# Altium project DockConnector.PrjPcb
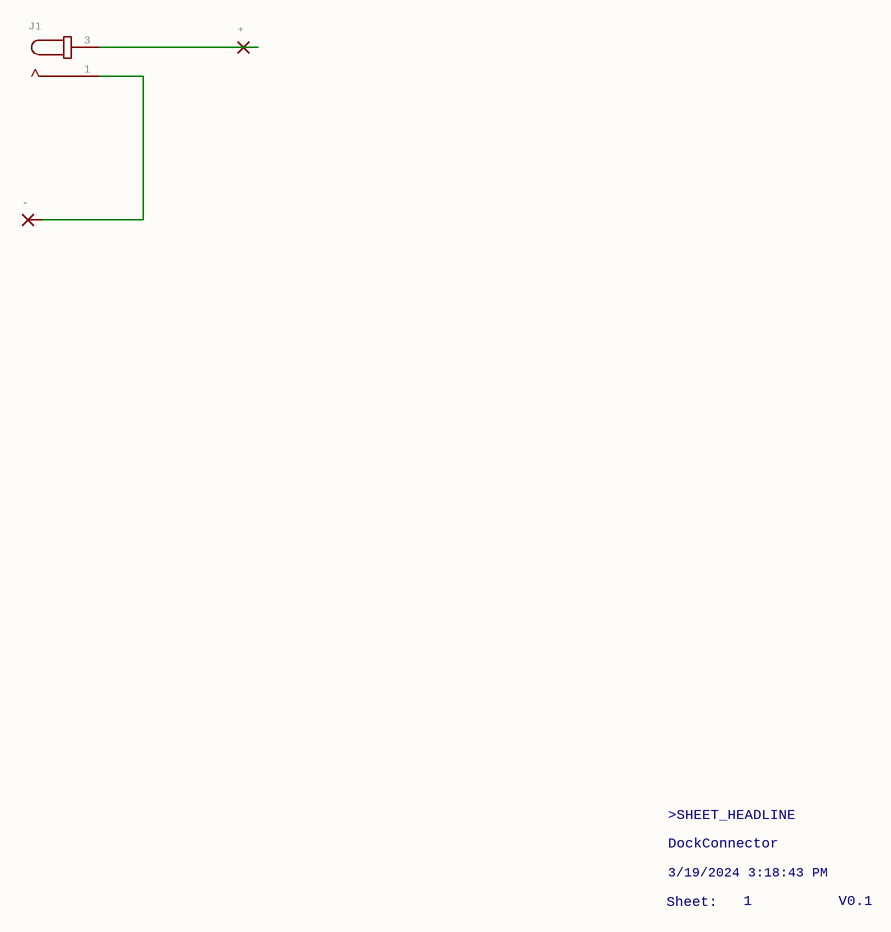
[diagram p0: DockConnector.SchDoc]
1 sheet, 3 parts. Net scope: global (net labels, ports and power ports of the same name join across sheets).
Board file: DockConnector.PcbDoc

## Sheet DockConnector.SchDoc: DockConnector
size 292 x 217 mm; Origin: Eagle; Date: 3/19/2024 3:18:43 PM; SheetNumber: 1; SCHEMATIC_VERSION: SCHEMATIC_VERSION; GateName_1: G$1; SymbolName_1: A4L-LOC; LibraryName: frames_corvus; DeviceSetName: A4L-LOC; Sheet: Sheet:

### Parts
+  WIREPAD_2,54/1,1  [WIREPAD_2,54/1,1]  (value not drawn)
-  WIREPAD_2,54/1,1  [WIREPAD_2,54/1,1]  (value not drawn)
J1  CON-JACK_JACK-PLUG0  [CON-JACK_SPC4077]  (value not drawn)

### Nets
Net+_1: +.1(P) J1.3
Net-_1: -.1(P) J1.1

### Notes on the sheet
- >SHEET_HEADLINE
- Sheet:
- DockConnector
- 3/19/2024 3:18:43 PM
- 1
- V0.1

### Library data of the parts
+ - = WIREPAD_2,54/1,1: THROUGH-HOLE PAD; GateName_1: 1; SymbolName_1: WIREPAD_PAD; POPULARITY: 6; LibraryName: OnTopCharger; DeviceSetName: WIREPAD_2,54/1,1
J1 = CON-JACK_JACK-PLUG0: DC POWER JACK Power Jack, DC, Right Angle, Through Hole, Rated 5A at 16VDC, PC Terminals   Distributor: Farnell (www.Farnell.de) Drawing: 84N1161.pdf / 84N1162.pdf Manufacturer: SPC Technology (www.spctechnology.com) Type: SPC4077 / SPC 4078; GateName_1: G$1; DeviceName: 0; SymbolName_1: CON-JACK_JACK-PLUG; LibraryName: OnTopCharger; DeviceSetName: CON-JACK_JACK-PLUG; MF: MF; MPN: MPN; OC_FARNELL: unknown; OC_NEWARK: unknown; POPULARITY: 0